# Altium schematic sheet Sch_Z35.SchDoc: Z35
size D; Author: Mohammadreza Zourmand; CompanyName: Daya; DrawnBy: Mohammadreza Zourmand; Engineer: Mohammadreza Zourmand; SheetNumber: 1; SheetTotal: 3; ProjectName: Birds Training
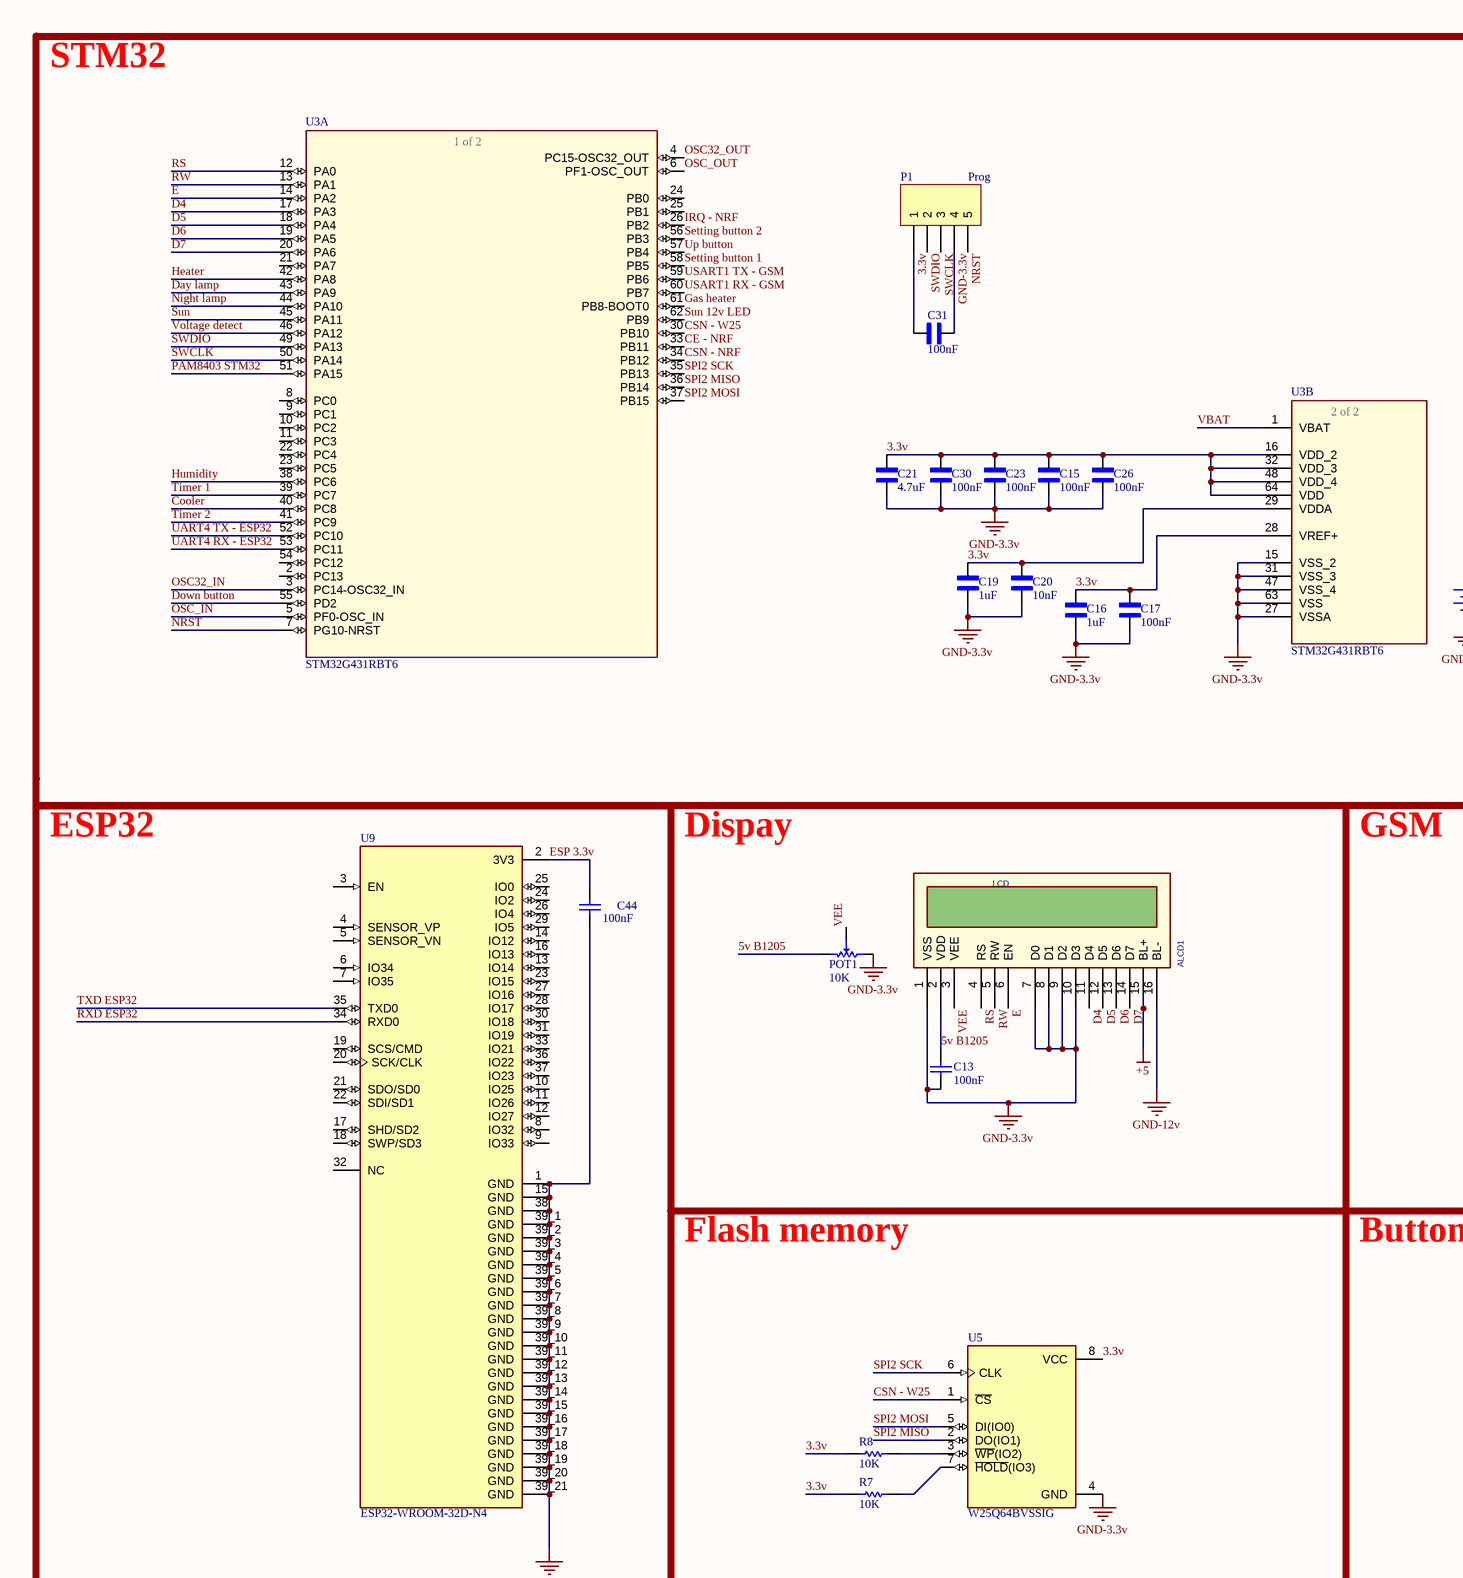
[diagram p0: Sch_Z35.SchDoc, top left]
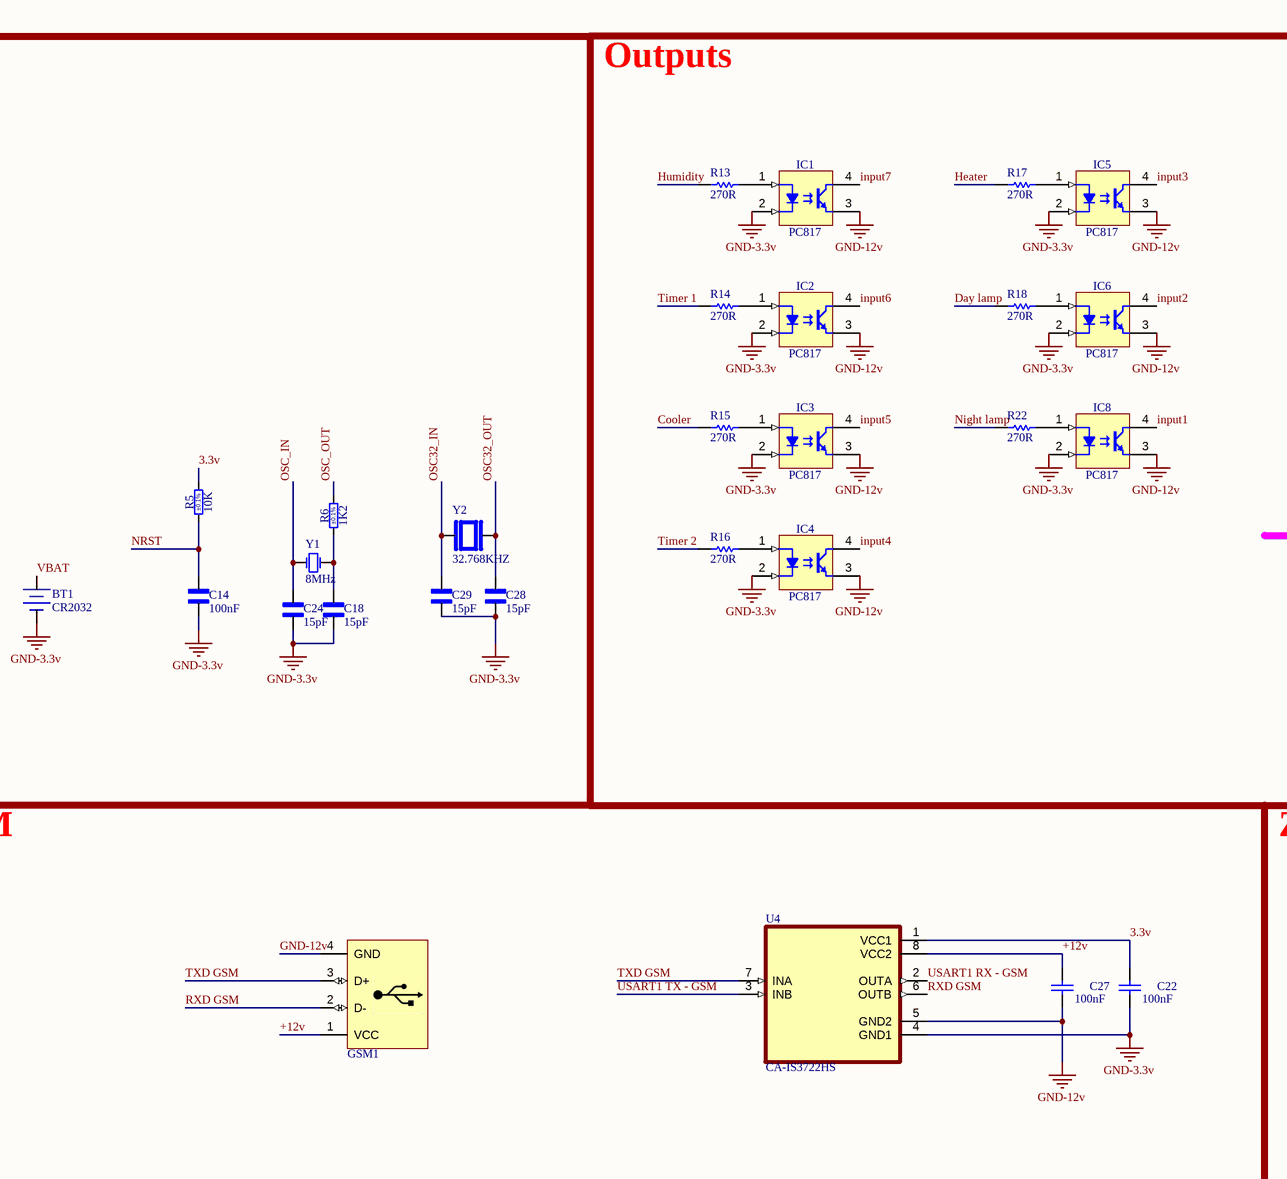
[diagram p1: Sch_Z35.SchDoc, top middle]
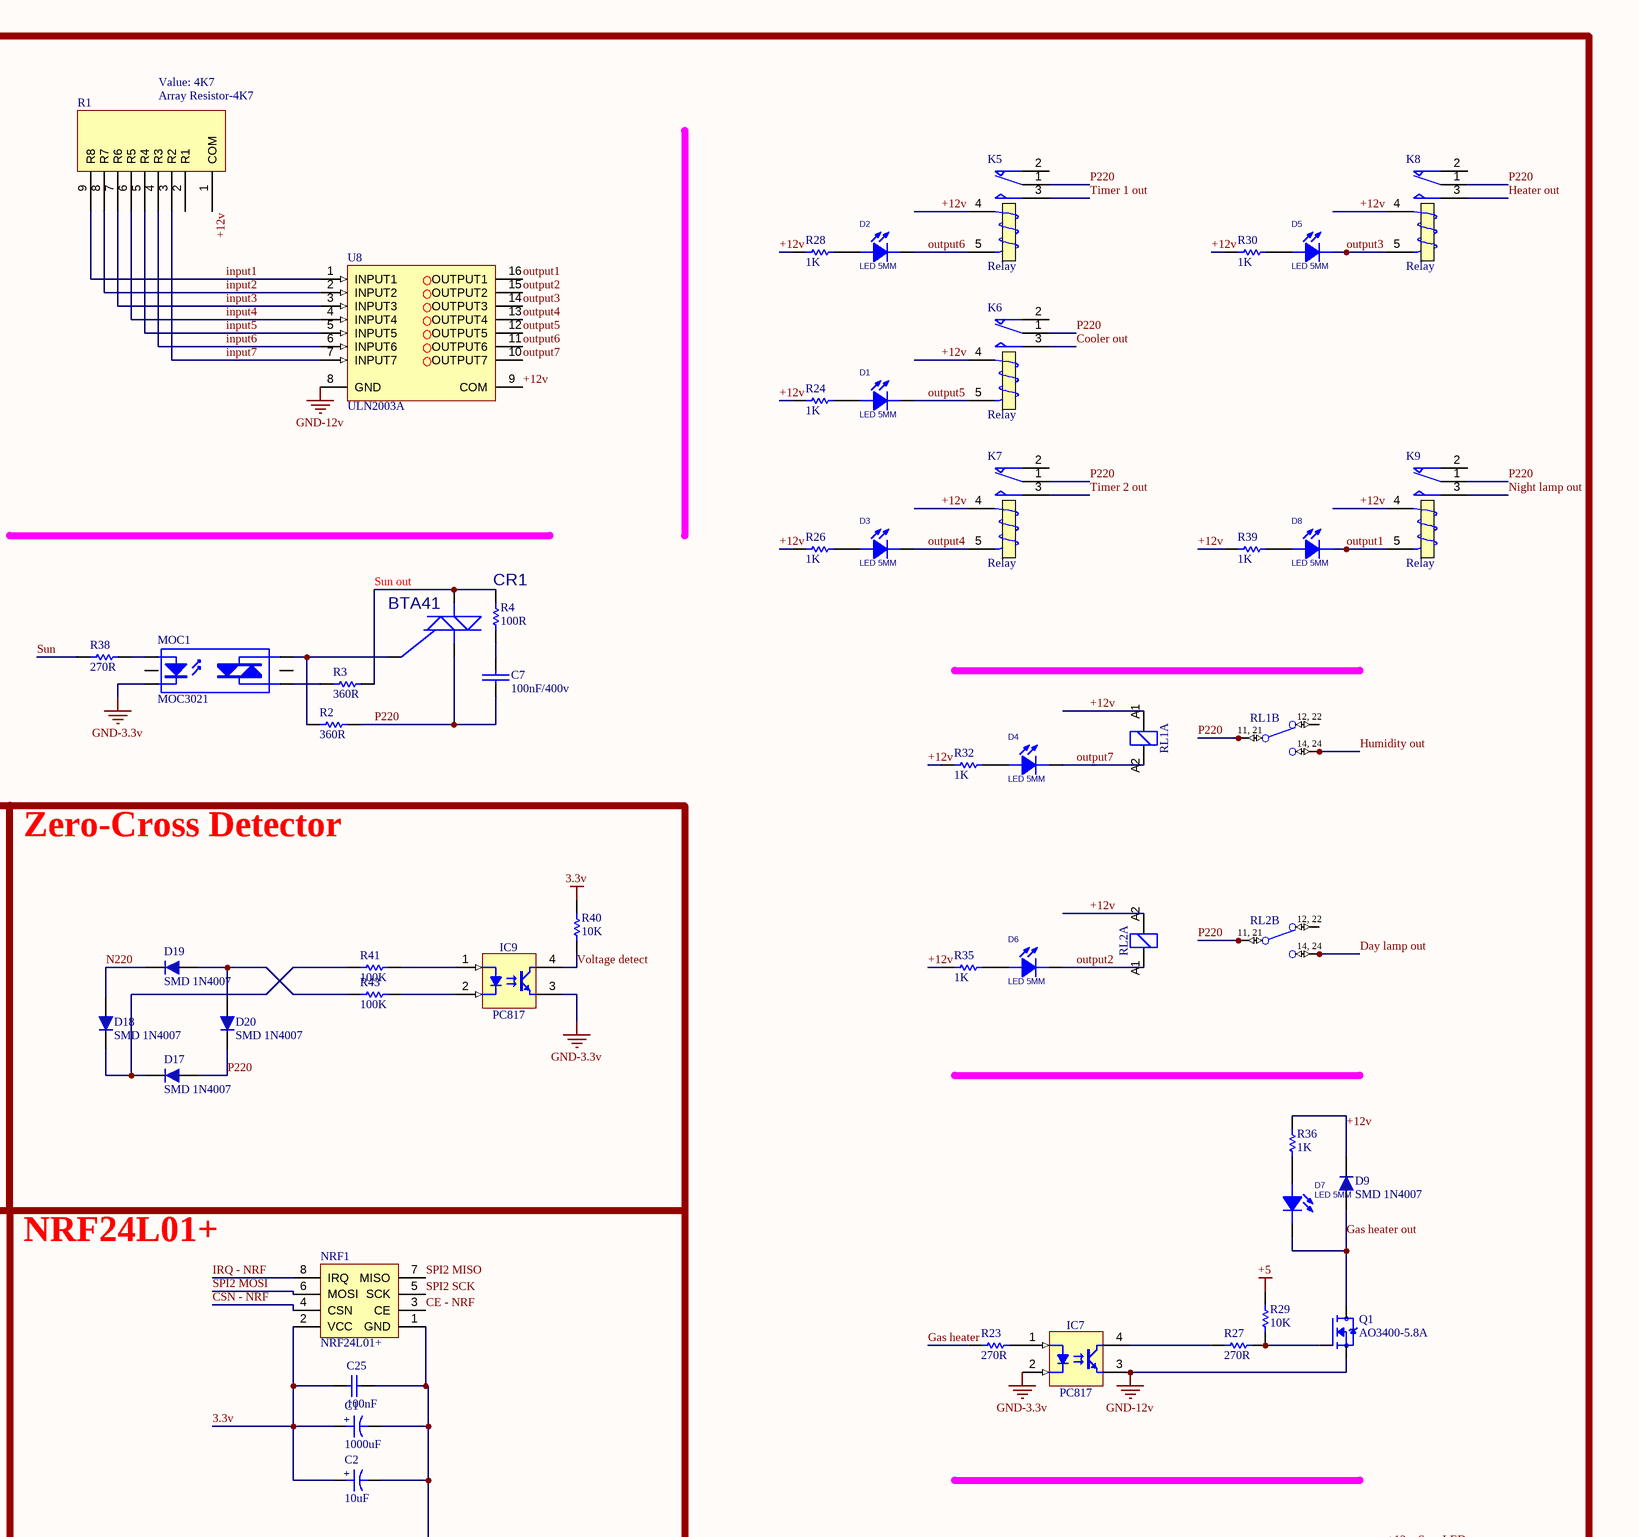
[diagram p2: Sch_Z35.SchDoc, top right]
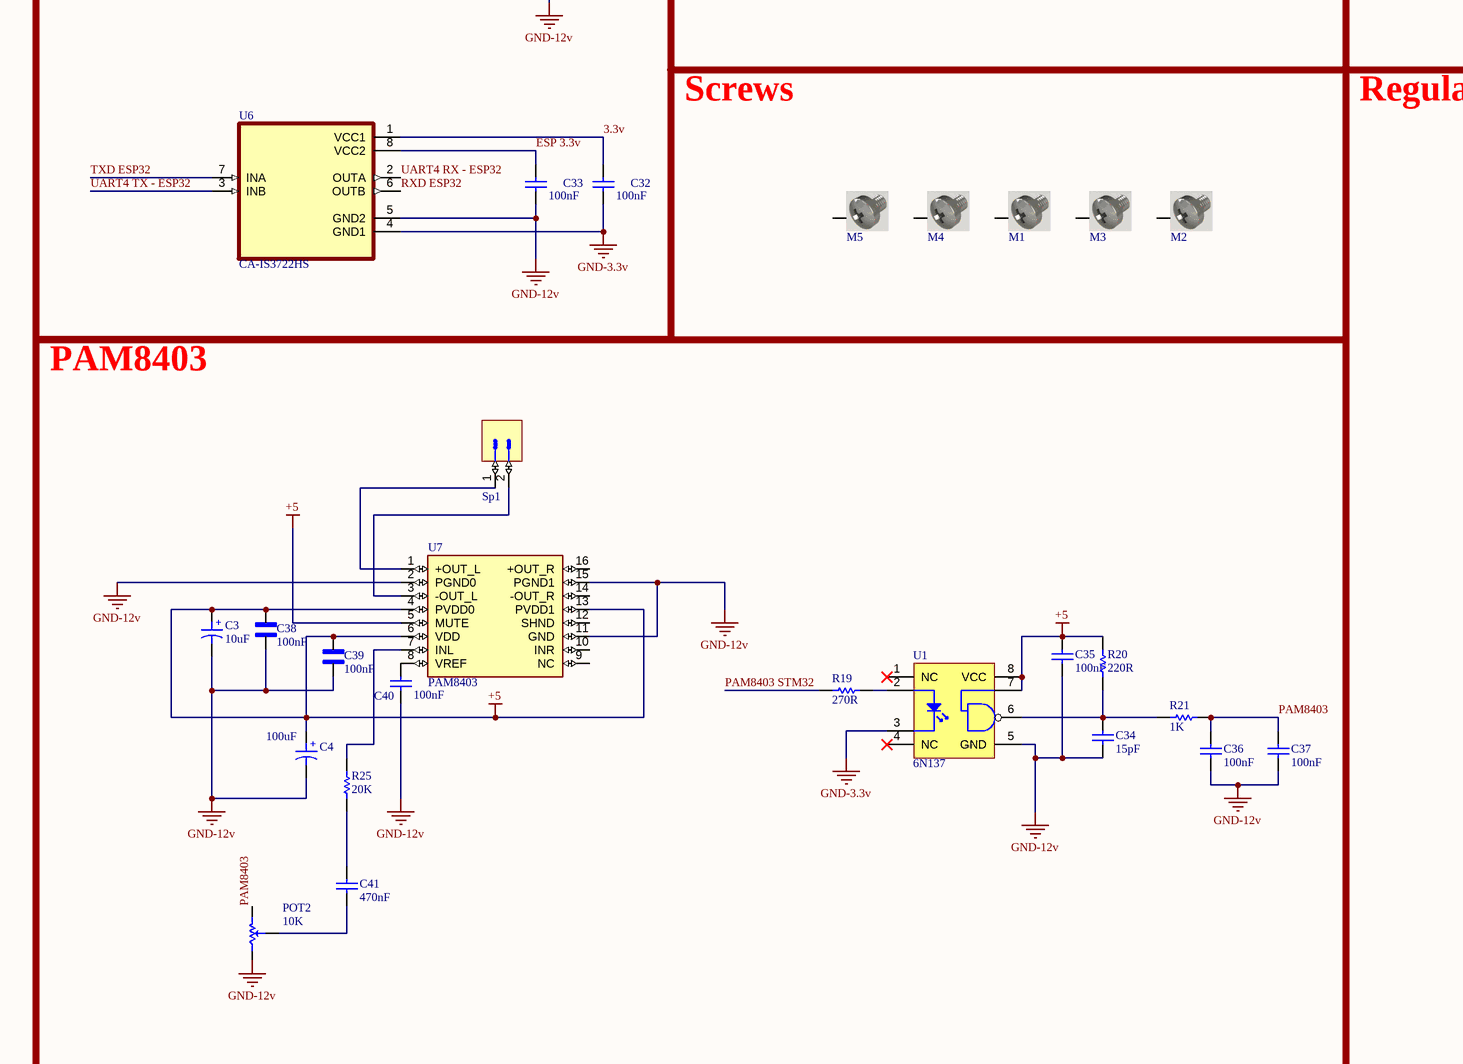
[diagram p3: Sch_Z35.SchDoc, bottom left]
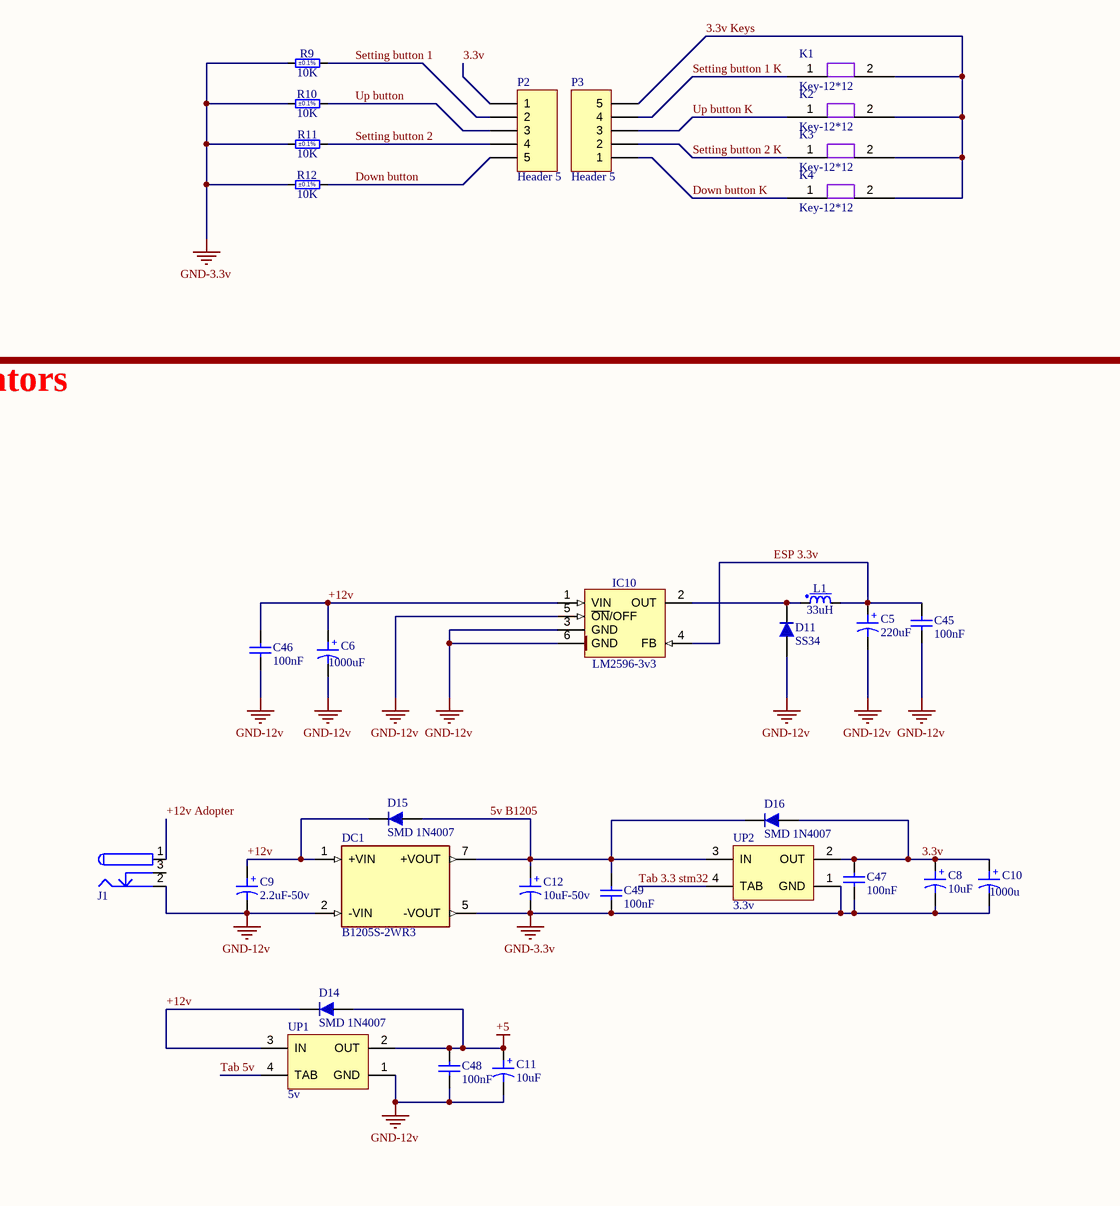
[diagram p4: Sch_Z35.SchDoc, bottom middle]
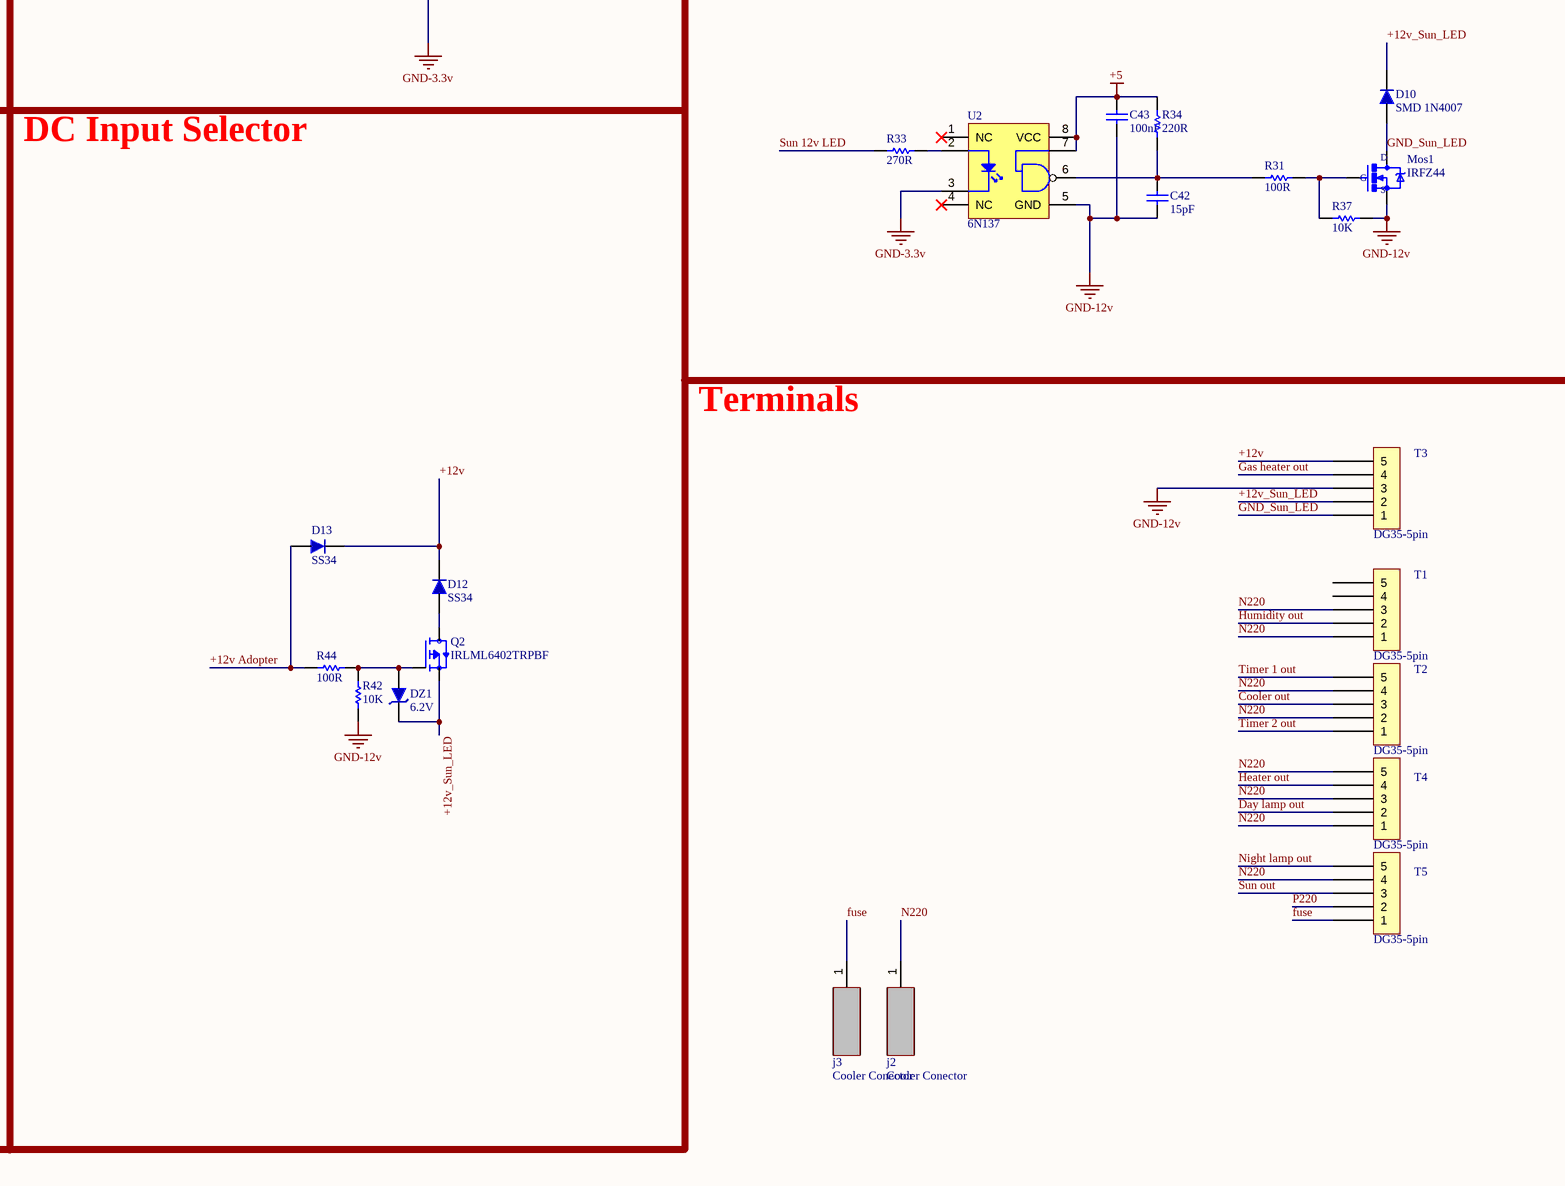
[diagram p5: Sch_Z35.SchDoc, bottom right]

## Parts
ALCD1  LCD  [LCD 16x2]
BT1  CR2032  [BAT BACKUP]
C1  1000uF  [Cap electrolitic radial 8x14-3.5]
C2  10uF  [Cap electrolitic radial 6.3x12-2.5]
C3  10uF  [Cap electrolitic radial 4x7-1.5]
C4  100uF  [Cap electrolitic radial 4x7-1.5]
C5  220uF  [Cap electrolitic radial 6.3x12-2.5]
C6  1000uF  [Cap electrolitic radial 8x14-3.5]
C7  100nF/400v  [Cap - 100nF - 400V]
C8  10uF  [Cap electrolitic radial 6.3x12-2.5]
C9  2.2uF-50v  [Cap electrolitic radial 4x7-1.5]
C10  1000u  [Cap electrolitic radial 8x14-3.5]
C11  10uF  [Cap electrolitic radial 6.3x12-2.5]
C12  10uF-50v  [Cap electrolitic radial 4x7-1.5]
C13  100nF  [CAPC3413X12N]
C14  100nF  [CAPC1608X90]
C15  100nF  [CAPC1608X90]
C16  1uF  [CAPC1608X90]
C17  100nF  [CAPC1608X90]
C18  15pF  [CAPC1608X90]
C19  1uF  [CAPC1608X90]
C20  10nF  [CAPC1608X90]
C21  4.7uF  [CAPC1608X90]
C22  100nF  [CAPC3413X12N]
C23  100nF  [CAPC1608X90]
C24  15pF  [CAPC1608X90]
C25  100nF  [CAPC3413X12N]
C26  100nF  [CAPC1608X90]
C27  100nF  [CAPC3413X12N]
C28  15pF  [CAPC1608X90]
C29  15pF  [CAPC1608X90]
C30  100nF  [CAPC1608X90]
C31  100nF  [CAPC1608X90]
C32  100nF  [CAPC3413X12N]
C33  100nF  [CAPC3413X12N]
C34  15pF  [CAPC3413X12N]
C35  100nF  [CAPC3413X12N]
C36  100nF  [CAPC3413X12N]
C37  100nF  [CAPC3413X12N]
C38  100nF  [CAPC1608X90]
C39  100nF  [CAPC1608X90]
C40  100nF  [CAPC3413X12N]
C41  470nF  [CAPC3413X12N]
C42  15pF  [CAPC3413X12N]
C43  100nF  [CAPC3413X12N]
C44  100nF  [CAPC3413X12N]
C45  100nF  [CAPC3413X12N]
C46  100nF  [CAPC3413X12N]
C47  100nF  [CAPC3413X12N]
C48  100nF  [CAPC3413X12N]
C49  100nF  [CAPC3413X12N]
CR1  BTA41  [BTA41]
D1  LED 5MM  [LED5MM_YELLOW]
D2  LED 5MM  [LED5MM_YELLOW]
D3  LED 5MM  [LED5MM_YELLOW]
D4  LED 5MM  [LED5MM_YELLOW]
D5  LED 5MM  [LED5MM_YELLOW]
D6  LED 5MM  [LED5MM_YELLOW]
D7  LED 5MM  [LED5MM_YELLOW]
D8  LED 5MM  [LED5MM_YELLOW]
D9  SMD 1N4007  [DIODE SMD]
D10  SMD 1N4007  [DIODE SMD]
D11  SS34  [DIODE SMD]
D12  SS34  [DIODE SMD]
D13  SS34  [DIODE SMD]
D14  SMD 1N4007  [DIODE SMD]
D15  SMD 1N4007  [DIODE SMD]
D16  SMD 1N4007  [DIODE SMD]
D17  SMD 1N4007  [DIODE SMD]
D18  SMD 1N4007  [DIODE SMD]
D19  SMD 1N4007  [DIODE SMD]
D20  SMD 1N4007  [DIODE SMD]
DC1  B1205S-2WR3  [CONV_RKZE-1205S/HP]
DZ1  6.2V  [SOD80, LL-34]
GSM1  USB Connector  [USB2.5-2H4C]  (value not drawn)
IC1  PC817  [WURTH_140817143400]
IC2  PC817  [WURTH_140817143400]
IC3  PC817  [WURTH_140817143400]
IC4  PC817  [WURTH_140817143400]
IC5  PC817  [WURTH_140817143400]
IC6  PC817  [WURTH_140817143400]
IC7  PC817  [WURTH_140817143400]
IC8  PC817  [WURTH_140817143400]
IC9  PC817  [WURTH_140817143400]
IC10  LM2596-3v3  [TO170P1435X465-6N-R1041X635]
J1  DC Power Jack  [DC Power Jack 1]  (value not drawn)
j2  Cooler Conector  [Cooler Conector]
j3  Cooler Conector  [Cooler Conector]
K1  Key-12*12  [Switch_11_11]
K2  Key-12*12  [Switch_11_11]
K3  Key-12*12  [Switch_11_11]
K4  Key-12*12  [Switch_11_11]
K5  Relay  [Relay 18.85x15.35x15.70]
K6  Relay  [Relay 18.85x15.35x15.70]
K7  Relay  [Relay 18.85x15.35x15.70]
K8  Relay  [Relay 18.85x15.35x15.70]
K9  Relay  [Relay 18.85x15.35x15.70]
L1  33uH  [IND_PANASONIC_ELL6RH]
M1  Screw3mm  [Board Screw 3mm]  (value not drawn)
M2  Screw3mm  [Board Screw 3mm]  (value not drawn)
M3  Screw3mm  [Board Screw 3mm]  (value not drawn)
M4  Screw3mm  [Board Screw 3mm]  (value not drawn)
M5  Screw3mm  [Board Screw 3mm]  (value not drawn)
MOC1  MOC3021  [DIP-6]
Mos1  IRFZ44  [TO-220]
NRF1  NRF24L01+  [NRF24L01P]
P1  Prog  [HDR1X5]
P2  Header 5  [HDR1X5]
P3  Header 5  [HDR1X5]
POT1  10K  [POT 4]
POT2  10K  [POT 4]
Q1  AO3400-5.8A  [SOT95P260X140-3N]
Q2  IRLML6402TRPBF  [SOT95P237X112-3N]
R1  Array Resistor-4K7  value 4K7  [Res Array]
R2  360R  [Axial 0_25 W, 0_4 IN LEAD PITCH]
R3  360R  [Axial 0_25 W, 0_4 IN LEAD PITCH]
R4  100R  [Axial 0_25 W, 0_4 IN LEAD PITCH]
R5  10K  Tolerance: ±0.1%  [RESC1608X55N]
R6  1K2  Tolerance: ±0.1%  [RESC1608X55N]
R7  10K  [RESC3413X04N]
R8  10K  [RESC3413X04N]
R9  10K  Tolerance: ±0.1%  [RESC1608X55N]
R10  10K  Tolerance: ±0.1%  [RESC1608X55N]
R11  10K  Tolerance: ±0.1%  [RESC1608X55N]
R12  10K  Tolerance: ±0.1%  [RESC1608X55N]
R13  270R  [RESC3413X04N]
R14  270R  [RESC3413X04N]
R15  270R  [RESC3413X04N]
R16  270R  [RESC3413X04N]
R17  270R  [RESC3413X04N]
R18  270R  [RESC3413X04N]
R19  270R  [RESC3413X04N]
R20  220R  [RESC3413X04N]
R21  1K  [RESC3413X04N]
R22  270R  [RESC3413X04N]
R23  270R  [RESC3413X04N]
R24  1K  [RESC4817X04N]
R25  20K  [RESC3413X04N]
R26  1K  [RESC4817X04N]
R27  270R  [RESC3413X04N]
R28  1K  [RESC4817X04N]
R29  10K  [RESC3413X04N]
R30  1K  [RESC4817X04N]
R31  100R  [RESC3413X04N]
R32  1K  [RESC4817X04N]
R33  270R  [RESC3413X04N]
R34  220R  [RESC3413X04N]
R35  1K  [RESC4817X04N]
R36  1K  [RESC4817X04N]
R37  10K  [RESC3413X04N]
R38  270R  [RESC3413X04N]
R39  1K  [RESC4817X04N]
R40  10K  [RESC3413X04N]
R41  100K  [RESC4817X04N]
R42  10K  [RESC3413X04N]
R43  100K  [RESC4817X04N]
R44  100R  [RESC3413X04N]
RL1  REL_FINDER_40.61  [REL_FINDER_40.61]  (value not drawn)  (parts A,B of 2)
RL2  REL_FINDER_40.61  [REL_FINDER_40.61]  (value not drawn)  (parts A,B of 2)
Sp1  KK®  [MOLEX_22-04-1021]  (value not drawn)
T1  DG35-5pin  [DG35-5pin]
T2  DG35-5pin  [DG35-5pin]
T3  DG35-5pin  [DG35-5pin]
T4  DG35-5pin  [DG35-5pin]
T5  DG35-5pin  [DG35-5pin]
U1  6N137  [DIP8]
U2  6N137  [DIP8]
U3  STM32G431RBT6  [LQFP64-10X10MM]  (parts A,B of 2)
U4  CA-IS3722HS  [SOIC127P599X175-8N]
U5  W25Q64BVSSIG  [SOIC127P790X216-8N]
U6  CA-IS3722HS  [SOIC127P599X175-8N]
U7  PAM8403  [SOP-16]
U8  ULN2003A  [SO16_M]
U9  ESP32-WROOM-32D-N4  [MODULE_ESP32-WROOM-32D-N4]
UP1  5v  [SOT223]
UP2  3.3v  [SOT223]
Y1  8MHz  [Crystal SMD]
Y2  32.768KHZ  [XTAL_ABS09-32.768KHZ-T]

## Blocks framed on the sheet
ESP32: C32 C33 C44 U6 U9

## Nets
3.3v: C1.1 C2.1 C8.1 C10.1 C15.1 C16.1 C17.1 C19.1 C20.1 C21.1 C22.1 C23.1 C25.2 C26.1 C30.1 C31.1 C32.1 C47.1 D16.1 NRF1.2(VCC) P1.1 P2.1 R5.2 R7.2 R8.2 R40.1 U3.16(VDD_2) U3.28(VREF+) U3.29(VDDA) U3.32(VDD_3) U3.48(VDD_4) U3.64(VDD) U4.1(VCC1) U5.8(VCC) U6.1(VCC1) UP2.2(OUT)
+5: ALCD1.15(BL+) C3.1 C4.1 C11.1 C35.1 C38.1 C39.1 C43.1 C48.1 D14.1 R20.2 R29.2 R34.2 U1.7(Ve) U1.8(VCC) U2.7(Ve) U2.8(VCC) U7.4(PVDD0) U7.5(MUTE) U7.6(VDD) U7.13(PVDD1) UP1.2(OUT)
GND-3.3v: ALCD1.1(VSS) ALCD1.7(D0) ALCD1.8(D1) ALCD1.9(D2) ALCD1.10(D3) BT1.2(-) C1.2 C2.2 C8.2 C10.2 C12.2 C13.2 C14.2 C15.2 C16.2 C17.2 C18.2 C19.2 C20.2 C21.2 C22.2 C23.2 C24.2 C25.1 C26.2 C28.2 C29.2 C30.2 C31.2 C32.2 C47.2 C49.2 DC1.5(-VOUT) IC1.2(C) IC2.2(C) IC3.2(C) IC4.2(C) IC5.2(C) IC6.2(C) IC7.2(C) IC8.2(C) IC9.3(E) MOC1.2(K) NRF1.1(GND) P1.4 POT1.1(CCW) R9.1 R10.1 R11.1 R12.1 U1.3(K) U2.3(K) U3.15(VSS_2) U3.27(VSSA) U3.31(VSS_3) U3.47(VSS_4) U3.63(VSS) U4.4(GND1) U5.4(GND) U6.4(GND1) UP2.1(GND)
GND-12v: ALCD1.16(BL-) C3.2 C4.2 C5.2 C6.2 C9.2 C11.2 C27.2 C33.2 C34.2 C35.2 C36.2 C37.2 C38.2 C39.2 C40.2 C42.2 C43.2 C44.2 C45.2 C46.2 C48.2 D11.1 DC1.2(-VIN) GSM1.4(GND) IC1.3(E) IC2.3(E) IC3.3(E) IC4.3(E) IC5.3(E) IC6.3(E) IC7.3(E) IC8.3(E) IC10.3(GND) IC10.5(~{ON}/OFF) IC10.6(GND) J1.2 Mos1.3(S) POT2.1(CCW) Q1.2(S) R37.1 R42.2 T3.3 U1.5(GND) U2.5(GND) U4.5(GND2) U6.5(GND2) U7.2(PGND0) U7.11(GND) U7.15(PGND1) U8.8(GND) U9.1(GND) U9.15(GND) U9.38(GND) U9.39_1(GND) U9.39_2(GND) U9.39_3(GND) U9.39_4(GND) U9.39_5(GND) U9.39_6(GND) U9.39_7(GND) U9.39_8(GND) U9.39_9(GND) U9.39_10(GND) U9.39_11(GND) U9.39_12(GND) U9.39_13(GND) U9.39_14(GND) U9.39_15(GND) U9.39_16(GND) U9.39_17(GND) U9.39_18(GND) U9.39_19(GND) U9.39_20(GND) U9.39_21(GND) UP1.1(GND)
3.3v Keys: K1.2 K2.2 K3.2 K4.2 P3.5
5v B1205: ALCD1.2(VDD) C12.1 C13.1 C49.1 D15.1 D16.2 DC1.7(+VOUT) POT1.2(CW) UP2.3(IN)
+12v: C6.1 C9.1 C27.1 C46.1 D9.2 D12.2 D13.2 D14.2 D15.2 DC1.1(+VIN) GSM1.1(VCC) IC10.1(VIN) K5.4(T1) K6.4(T1) K7.4(T1) K8.4(T1) K9.4(T1) R1.1(COM) R24.1 R26.1 R28.1 R30.1 R32.1 R35.1 R36.2 R39.1 RL1.A1(COIL) RL2.A2(COIL) T3.5 U4.8(VCC2) U8.9(COM) UP1.3(IN)
+12v Adopter: D13.1 J1.1 R44.2
+12v_Sun_LED: D10.2 DZ1.2 Q2.2(S) T3.2
CE - NRF: NRF1.3(CE) U3.33(PB11)
Cooler: R15.2 U3.40(PC8)
Cooler out: K6.3(NO) T2.3
CSN - NRF: NRF1.4(CSN) U3.34(PB12)
CSN - W25: U3.30(PB10) U5.1(~{CS})
D4: ALCD1.11(D4) U3.17(PA3)
D5: ALCD1.12(D5) U3.18(PA4)
D6: ALCD1.13(D6) U3.19(PA5)
D7: ALCD1.14(D7) U3.20(PA6)
Day lamp: R18.2 U3.43(PA9)
Day lamp out: RL2.14(NO) RL2.24(NO) T4.2
Down button: P2.5 R12.2 U3.55(PD2)
Down button K: K4.1 P3.1
E: ALCD1.6(EN) U3.14(PA2)
ESP 3.3v: C5.1 C33.1 C44.1 C45.1 IC10.4(FB) L1.2 U6.8(VCC2) U9.2(3V3)
fuse: j3.1 T5.1
Gas heater: R23.2 U3.61(PB8-BOOT0)
Gas heater out: D7.2(CATHODE) D9.1 Q1.3(D) T3.4
GND_Sun_LED: D10.1 Mos1.2(D) T3.1
Heater: R17.2 U3.42(PA8)
Heater out: K8.3(NO) T4.4
Humidity: R13.2 U3.38(PC6)
Humidity out: RL1.14(NO) RL1.24(NO) T1.2
input1: IC8.4(C) R1.9(R8) U8.1(INPUT1)
input2: IC6.4(C) R1.8(R7) U8.2(INPUT2)
input3: IC5.4(C) R1.7(R6) U8.3(INPUT3)
input4: IC4.4(C) R1.6(R5) U8.4(INPUT4)
input5: IC3.4(C) R1.5(R4) U8.5(INPUT5)
input6: IC2.4(C) R1.4(R3) U8.6(INPUT6)
input7: IC1.4(C) R1.3(R2) U8.7(INPUT7)
IRQ - NRF: NRF1.8(IRQ) U3.26(PB2)
N220: D18.1 D19.2 j2.1 T1.1 T1.3 T2.2 T2.4 T4.1 T4.3 T4.5 T5.4
Night lamp: R22.2 U3.44(PA10)
Night lamp out: K9.3(NO) T5.5
NRST: C14.1 P1.5 R5.1 U3.7(PG10-NRST)
OSC32_IN: C29.1 U3.3(PC14-OSC32_IN) Y2.2
OSC32_OUT: C28.1 U3.4(PC15-OSC32_OUT) Y2.1
OSC_IN: C24.1 U3.5(PF0-OSC_IN) Y1.1(OSC1)
OSC_OUT: R6.2 U3.6(PF1-OSC_OUT)
output1: D8.2(CATHODE) K9.5(T2) U8.16(OUTPUT1)
output2: D6.2(CATHODE) RL2.A1(COIL) U8.15(OUTPUT2)
output3: D5.2(CATHODE) K8.5(T2) U8.14(OUTPUT3)
output4: D3.2(CATHODE) K7.5(T2) U8.13(OUTPUT4)
output5: D1.2(CATHODE) K6.5(T2) U8.12(OUTPUT5)
output6: D2.2(CATHODE) K5.5(T2) U8.11(OUTPUT6)
output7: D4.2(CATHODE) RL1.A2(COIL) U8.10(OUTPUT7)
P220: C7.2(-) CR1.1(A1) D17.1 D20.2 K5.1(COM) K6.1(COM) K7.1(COM) K8.1(COM) K9.1(COM) R2.2 RL1.11(C) RL1.21(C) RL2.11(C) RL2.21(C) T5.2
PAM8403: C36.1 C37.1 POT2.2(CW) R21.1
PAM8403 STM32: R19.2 U3.51(PA15)
RS: ALCD1.4(RS) U3.12(PA0)
RW: ALCD1.5(RW) U3.13(PA1)
RXD ESP32: U6.6(OUTB) U9.34(RXD0)
RXD GSM: GSM1.2(D-) U4.6(OUTB)
Setting button 1: P2.2 R9.2 U3.58(PB5)
Setting button 1 K: K1.1 P3.4
Setting button 2: P2.4 R11.2 U3.56(PB3)
Setting button 2 K: K3.1 P3.2
SPI2 MISO: NRF1.7(MISO) U3.36(PB14) U5.2(DO(IO1))
SPI2 MOSI: NRF1.6(MOSI) U3.37(PB15) U5.5(DI(IO0))
SPI2 SCK: NRF1.5(SCK) U3.35(PB13) U5.6(CLK)
Sun: R38.2 U3.45(PA11)
Sun 12v LED: R33.2 U3.62(PB9)
Sun out: CR1.2(A2) R3.2 R4.2 T5.3
SWCLK: P1.3 U3.50(PA14)
SWDIO: P1.2 U3.49(PA13)
Tab 3.3 stm32: UP2.4(TAB)
Tab 5v: UP1.4(TAB)
Timer 1: R14.2 U3.39(PC7)
Timer 1 out: K5.3(NO) T2.5
Timer 2: R16.2 U3.41(PC9)
Timer 2 out: K7.3(NO) T2.1
TXD ESP32: U6.7(INA) U9.35(TXD0)
TXD GSM: GSM1.3(D+) U4.7(INA)
UART4 RX - ESP32: U3.53(PC11) U6.2(OUTA)
UART4 TX - ESP32: U3.52(PC10) U6.3(INB)
Up button: P2.3 R10.2 U3.57(PB4)
Up button K: K2.1 P3.3
USART1 RX - GSM: U3.60(PB7) U4.2(OUTA)
USART1 TX - GSM: U3.59(PB6) U4.3(INB)
VBAT: BT1.1(+) U3.1(VBAT)
VEE: ALCD1.3(VEE) POT1.3(SetPoint)
Voltage detect: IC9.4(C) R40.2 U3.46(PA12)
NetC7_1: C7.1(+) R4.1
NetC18_1: C18.1 R6.1 Y1.2(OSC2)
NetC34_1: C34.1 R20.1 R21.2 U1.6(Vo)
NetC40_1: C40.1 U7.8(VREF)
NetC41_1: C41.1 R25.1
NetC41_2: C41.2 POT2.3(SetPoint)
NetC42_1: C42.1 R31.2 R34.1 U2.6(Vo)
NetCR1_3: CR1.3(G) MOC1.4(A/K) R2.1
NetD1_1: D1.1(ANODE) R24.2
NetD2_1: D2.1(ANODE) R28.2
NetD3_1: D3.1(ANODE) R26.2
NetD4_1: D4.1(ANODE) R32.2
NetD5_1: D5.1(ANODE) R30.2
NetD6_1: D6.1(ANODE) R35.2
NetD7_1: D7.1(ANODE) R36.1
NetD8_1: D8.1(ANODE) R39.2
NetD11_2: D11.2 IC10.2(OUT) L1.1
NetD12_1: D12.1 Q2.3(D)
NetD17_2: D17.2 D18.2 R41.1
NetD19_1: D19.1 D20.1 R43.1
NetDZ1_1: DZ1.1 Q2.1(G) R42.1 R44.1
NetIC1_1: IC1.1(A) R13.1
NetIC2_1: IC2.1(A) R14.1
NetIC3_1: IC3.1(A) R15.1
NetIC4_1: IC4.1(A) R16.1
NetIC5_1: IC5.1(A) R17.1
NetIC6_1: IC6.1(A) R18.1
NetIC7_1: IC7.1(A) R23.1
NetIC7_4: IC7.4(C) R27.1
NetIC8_1: IC8.1(A) R22.1
NetIC9_1: IC9.1(A) R41.2
NetIC9_2: IC9.2(C) R43.2
NetMOC1_1: MOC1.1(A) R38.1
NetMOC1_6: MOC1.6(A/K) R3.1
NetMos1_1: Mos1.1(G) R31.1 R37.2
NetQ1_1: Q1.1(G) R27.2 R29.1
NetR7_1: R7.1 U5.7(~{HOLD}(IO3))
NetR8_1: R8.1 U5.3(~{WP}(IO2))
NetR19_1: R19.1 U1.2(A)
NetR25_2: R25.2 U7.7(INL)
NetR33_1: R33.1 U2.2(A)
NetRL1_12: RL1.12(NC) RL1.22(NC)
NetRL2_12: RL2.12(NC) RL2.22(NC)
NetSp1_1: Sp1.1 U7.1(+OUT_L)
NetSp1_2: Sp1.2 U7.3(-OUT_L)

Not connected (* = marked no-connect by the designer): J1 3; K5 2(NC); K6 2(NC); K7 2(NC); K8 2(NC); K9 2(NC); M1 S; M2 S; M3 S; M4 S; M5 S; MOC1 3(NC) 5(NC); R1 2(R1); T1 4 5; U1 1(NC)* 4(NC)*; U2 1(NC)* 4(NC)*; U3 2(PC13) 8(PC0) 9(PC1) 10(PC2) 11(PC3) 21(PA7) 22(PC4) 23(PC5) 24(PB0) 25(PB1) 54(PC12); U7 9(NC) 10(INR) 12(SHND) 14(-OUT_R) 16(+OUT_R); U9 3(EN) 4(SENSOR_VP) 5(SENSOR_VN) 6(IO34) 7(IO35) 8(IO32) 9(IO33) 10(IO25) 11(IO26) 12(IO27) 13(IO14) 14(IO12) 16(IO13) 17(SHD/SD2) 18(SWP/SD3) 19(SCS/CMD) 20(SCK/CLK) 21(SDO/SD0) 22(SDI/SD1) 23(IO15) 24(IO2) 25(IO0) 26(IO4) 27(IO16) 28(IO17) 29(IO5) 30(IO18) 31(IO19) 32(NC) 33(IO21) 36(IO22) 37(IO23)

## Notes on the sheet
- STM32
- Outputs
- Dispay
- GSM
- Zero-Cross Detector
- Flash memory
- Buttons
- NRF24L01+
- Screws
- Regulators
- DC Input Selector
- PAM8403
- Terminals
- DWG. NO.
- REV.
- SHT.
- REVISION
- DESCRIPTION
- DATE
- APPROVED
- THIS DOCUMENT AND THE DATA DISCLOSED HEREIN OR HEREWITH IS THE PROPERTY OF ALTIUM LIMITED AND MAY BE FREELY DISTRIBUTED IN WHOLE. NO RIGHTS ARE RESERVED OR EXPRESS OR IMPLIED WARANTEE GIVEN.
- ENG:
- DSN:
- APPROVALS
- PROJECT
- DOCUMENT REVISION:
- DESIGN ITEM:
- CHK:
- BOM:
- REFERENCE DOCUMENTS
- PROJECT REVISION:
- TITLE
- FAB DWG:
- PCB DWG:
- ASSY DWG:
- SCALE:
- SIZE
- D
- CAGE CODE
- FILE NAME
- DWG NO.
- SHEET
- OF
- REV
- (in symbol Cap ELECTROLITIC TOTAL SIZE) +
- (in symbol REL_FINDER_40.61.9.009.0000, part B) 12, 22; 11, 21; 14, 24
- (in symbol STM32G431RBT6, part A) 1 of 2
- (in symbol STM32G431RBT6, part B) 2 of 2

## Library data of the parts
ALCD1 = LCD: Alphanumic LCD; Designer: Abbas Basereh; Data: 16-12-2016
BT1 = Battry Backup: Designer: Abbas Basereh; Data: 16-12-2016; Link: *; Part. No: *
C1-C6 C8-C12 = Cap ELECTROLITIC TOTAL SIZE: Cap electrolitic radial; Designer: Abbas Basereh; VALUE: 1uF; Data: 16-12-2016; Part. No: *
C7 = Cap-Bipolar: Bipolar Capacitor; Voltage: 100V; Designer: Saeid Jorablo; Organazation: ControTec; Adding Date: 1387/12/20; Value: 100nF/400v
C13 C22 C25 C27 C32-C37 C40-C49 = CAP SMD 0805: CAP 0805; Designer: Abbas Basereh; Desc.: CAP SMD 0805; Data: 16-12-2016
C14-C21 C23 C24 C26 C28-C31 C38 C39 = Cap 0603: 0603 C 100nF Ceramic Multilayer Capacitor, 25 V, +125degC, X7R Dielectric, +/-5% | KEMET C0603C104J3RACTU; SnapEDA_Link: https://www.snapeda.com/parts/C0603C104J3RACTU/KEMET/view-part/?ref=snap; Package: 603-2 KEMET; Value: *; MF: KEMET; MP: C0603C104J3RACTU; Check_prices: https://www.snapeda.com/parts/C0603C104J3RACTU/KEMET/view-part/?ref=eda
CR1 = BTA41: Manufacturer_Part_Number: BTA41-600BRG; C: Copyright (C) 2015 Accelerated Designs. All rights reserved; Vendor: STMicroelectronics; Built_By: EMA_UL_Team; SourceLibrary: StMicro_2011-06-07
D1-D8 = LED 5MM: Light Emitting Diode; Designer: Abbas Basereh; Data: 16-12-2016; Link: *; Part.No: *
D9-D20 = Diode SMD Package: Diode SMD Pakage
DC1 = B1205S-2WR3: 2W, constant voltage input, isolated ,unregulated single output, DC DC power module; MP: RKZE-1205S/HP; Package: None; Price: None; Value: *; Availability: Unavailable
DZ1 = ZENER GENERAL DIODE: DIODE ZENER GENERAL; VALUE: 12V; Published: 2017-1-12; PackageVersion: 2017-1-12; PackageReference: DO 35; Publisher: Abbas Basereh; PackageDescription: DIODE GEN ZENER; ComponentLink1Description: Manufacturer Link; ComponentLink2Description: Datasheet
GSM1 = USB A-Type: USB Connector-A Type
IC1-IC9 = 140817143400: Single Optocoupler-PC817; Part Description: WL-OCPT Optocoupler Phototransistor; Manufacturer: WURTH; PressFit: No; Bonding: No; Part Number: 140817143400; Component Kind: Standard; Component Type: Standard; Device: 140817143400; PackageDescription: DIP Gull Wing Surface Mount, 2.54mm Pitch; 4 Pin, 6.5mm W X 4.58mm L X 3.9mm H body, WURTH; Manufacturer Part Number: 140817143400; Pin Count: 4; Case: DIP4 SMD; Mounted: Yes; Socket: No; SMD: Yes; Sense: No; ComponentHeight: 3.9mm; HelpURL: \\cern.ch\dfs\Applications\Altium\Datasheets\WURTH_140817143400.pdf; Author: CERN DEM HF; CreateDate: 4/5/2023; LatestRevisionDate: 4/5/2023
IC10 = LM2596S-5.0/NOPB: SIMPLE SWITCHER® Power Converter 150kHz, 3A Step-Down Voltage Regulator; Part Description: 4.5V to 40V Input to 5V Output, SIMPLE SWITCHER® Power Converter 150kHz, 3A Step-Down Voltage Regulator; Manufacturer: TEXAS INSTRUMENTS; PressFit: No; Bonding: No; Part Number: LM2596S-5.0/NOPB; Component Kind: Standard; Component Type: Standard; Device: LM2596S-5.0/NOPB; PackageDescription: D2PAK TO-263, TO, 1.70mm Pitch; 5 Pin, 14.35mm L X 8.64mm W X 4.65mm H body IPC Medium Density; Manufacturer Part Number: LM2596S-5.0; Pin Count: 6; Case: TO-263-5; Mounted: Yes; Socket: No; SMD: Yes; Sense: No; ComponentHeight: 4.65mm; HelpURL: \\cern.ch\dfs\Applications\Altium\Datasheets\LM2596S-5.0-NOPB.pdf; Author: CERN DEM JLC; CreateDate: 12/19/2018; LatestRevisionDate: 6/1/2022
J1 = DC Power Jack: DC Power Jack. Center Pin 2.5mm. Diameter: 5.7mm; Designer: Ali Hafizi; Company: Personal; Project Name: Laser; Adding Date: 10/21/2009
j2 j3 = Cooler Conector: 0.5mm pins
K1-K4 = Switch_11_11
K5-K9 = Relay: SPDT Relay; Designer: Eng. Saeid Jorablo; Company: E.P.I.L; Design_Date: 2011/10/31
L1 = IND_33UH_20%_PANASONIC_ELL6RH330M: Inductor With Magnetic core 1Dot; Part Description: SMD Choke Coil; Power: 600mA; Resistance: 0.38R; Tolerance: ±20%; Part Number: IND_33UH_20%_PANASONIC_ELL6RH330M; Component Kind: Standard; Component Type: Standard; Pin Count: 2; Value: 33uH; Manufacturer: PANASONIC; Manufacturer Part Number: ELL6RH330M; Mounted: Yes; Socket: No; SMD: Yes; Sense: No; ComponentHeight: 2.8mm; HelpURL: \\cern.ch\dfs\Applications\Altium\Datasheets\IND_PANASONIC_ELL6RH.pdf; Author: CERN DEM JMW; CreateDate: 1/9/2009; LatestRevisionDate: 1/9/2009
M1-M5 = Board Screw 3mm: Board Screw With Spacer 3mm; Designer: Abbas Basereh; Data: 16-12-2016; Link: *; Part. No: *
MOC1 = MOC3021-3: Opto-Triac; Designer: Seyed Mohsen Ghasemian; E-mail: picpars@gmail.com; Published: 17-11-2011; LatestRevisionDate: 17-11-2011; Publisher: www.picpars.com; WEB: www.picpars.com
Mos1 = IRFZ44: N-Channel 55V 51A _Tc_ 80W _Tc_ Through Hole TO-220AB; MF: Infineon Technologies; Value: *; Price: None; Package: TO-220 Infineon Technologies; SnapEDA_Link: https://www.snapeda.com/parts/IRFZ44/Infineon%20Technologies/view-part/568085/?ref=snap; Availability: Unavailable; MP: IRFZ44
NRF1 = NRF24L01P: RF Module; Ali Hafizi: Creature
P1-P3 = Header 5: Header, 5-Pin; LatestRevisionDate: 17-Jul-2002; LatestRevisionNote: Re-released for DXP Platform.; Publisher: Altium Limited
POT1 POT2 = POT: Variable Resistor; Value: 10K
Q1 = AO3400-5.8A: N-Channel 30 V 5.8A (Ta) 1.5W (Ta) Surface Mount SOT-23; MF: MDD; Check_prices: https://www.snapeda.com/parts/AO3400-5.8A/MDD/view-part/?ref=eda; Value: *; Availability: In Stock; MP: AO3400-5.8A; Price: None; Package: None; SnapEDA_Link: https://www.snapeda.com/parts/AO3400-5.8A/MDD/view-part/?ref=snap; Purchase-URL: https://pricing.snapeda.com/search/part/AO3400-5.8A/?ref=eda
Q2 = IRLML6402TRPBF: P-Channel 20 V 3.7A (Ta) 1.3W (Ta) Surface Mount Micro3Ã¢â€žÂ¢ /SOT-23; MF: Infineon; SnapEDA_Link: https://www.snapeda.com/parts/IRLML6402TRPBF/Infineon/view-part/?ref=snap; Package: SOT-23-3 ON Semiconductor; Value: *; MP: IRLML6402TRPBF; Check_prices: https://www.snapeda.com/parts/IRLML6402TRPBF/Infineon/view-part/?ref=eda
R1 = RES Array: Resistor Pack
R2-R4 = RES Axial 0.25W: Designer: Abbas Basereh; Desc.: RES Axial 0.25W; Data: 4-1-2017
R5 R6 R9-R12 = R0603_100K_0.1%_0.063W_10PPM: Resistor - 0.1%; Part Description: Thin Film Chip Resistor; Manufacturer: GENERIC; Manufacturer1 Part Number: RN73C1J100KBTDF; Value: 100k; Power: 0.063W; TC: ±10ppm; PressFit: No; Part Number: R0603_100K_0.1%_0.063W_10PPM; Component Kind: Standard; Component Type: Standard; Pin Count: 2; Status: Not Recommended; Manufacturer Part Number: R0603_100K_0.1%_0.063W_10PPM; Case: 0603; Mounted: Yes; Sense: No; Socket: No; SMD: Yes; Manufacturer1 Example: TYCO HOLSWORTHY; Manufacturer1 ComponentHeight: 0.55mm; HelpURL: \\cern.ch\dfs\Applications\Altium\Datasheets\R0603_Tyco_RN73.pdf; Author: CERN DEM JLC; CreateDate: 12/3/2007; LatestRevisionDate: 3/13/2008
R7 R8 R13-R23 R25 R27 R29 R31 R33 R34 R37 R38 R40 R42 R44 = RES 0805 0.125W: RES 0805; Designer: Abbas Basereh; Desc.: RES SMD 0805; Data: 16-12-2016
R24 R26 R28 R30 R32 R35 R36 R39 R41 R43 = RES 1206 0.25W: RES 1206; Designer: Abbas Basereh; Desc.: RES SMD 1206; Data: 16-12-2016
RL1 RL2 = REL_FINDER_40.61.9.009.0000: 16A SPDT PCB Relay, 40.61 Serie; Part Description: 16A, SPDT PCB Relay, 40 Series; Manufacturer: FINDER; PressFit: No; Sense Comment: Non-washable; Status Comment: Sensitive (See Sensitive Field); Value: 9VDC; Part Number: REL_FINDER_40.61.9.009.0000; Component Kind: Standard; Component Type: Standard; Pin Count: 8; PackageDescription: 8 Leads, 1 Pole 16A Relay, FINDER 40.61 Serie, Body 29mm x 12.4mm; Mounted: Yes; Socket: No; SMD: No; Sense: Yes; Status: Not Recommended; Manufacturer Part Number: 40.61.9.009.0000; ComponentHeight: 25mm; HelpURL: \\cern.ch\dfs\Applications\Altium\Datasheets\REL_FINDER_40.61.pdf; Author: CERN DEM JLC; CreateDate: 8/6/2012; LatestRevisionDate: 8/30/2018
Sp1 = MOLEX_22-04-1021: Connector 2 Male; Part Description: 2.5mm (.100") Pitch KK® Wire-to-Board Header, Vertical, with Friction Lock, 2 Circuits, Tin (Sn) Plating; Manufacturer: MOLEX; PressFit: No; Part Number: MOLEX_22-04-1021; Component Kind: Standard; Component Type: Standard; Pin Count: 2; Family: KK®; Mounted: Yes; Socket: No; SMD: No; Sense: No; Status: Obsolete; Manufacturer Part Number: 22-04-1021; ComponentHeight: 11.7mm; HelpURL: \\cern.ch\dfs\Applications\Altium\Datasheets\MOLEX_22-04-1021.pdf; Author: CERN DEM JLC; CreateDate: 2/9/2012; LatestRevisionDate: 2/9/2012
T1-T5 = DG35-5pin: DG35C_Contacts pitch    8.25 mm
U1 U2 = 6N137: HIGH SPEED-10 MBit/s  LOGIC GATE OPTOCOUPLERS; Designer: Saeid Jorablo; Company: ControTEK; Adding Date: 1387/01/08
U3 = STM32G431RBT6: ARMÂ® CortexÂ®-M4F STM32G4 Microcontroller IC 32-Bit Single-Core 170MHz 128KB (128K x 8) FLASH 64-LQFP (10x10); MF: STMicroelectronics; SnapEDA_Link: https://www.snapeda.com/parts/STM32G431RBT6/STMicroelectronics/view-part/?ref=snap; Package: LQFP-64 STMicroelectronics; Value: *; MP: STM32G431RBT6; Check_prices: https://www.snapeda.com/parts/STM32G431RBT6/STMicroelectronics/view-part/?ref=eda
U4 U6 = ISO7221AD: CA-IS3722 High-Speed Dual-Channel Digital Isolators; MF: Texas Instruments; SnapEDA_Link: https://www.snapeda.com/parts/ISO7221AD/Texas+Instruments/view-part/?ref=snap; Package: SOIC-8 Texas Instruments; Value: *; MP: ISO7221AD; Check_prices: https://www.snapeda.com/parts/ISO7221AD/Texas+Instruments/view-part/?ref=eda
U5 = W25Q64BVSSIG: FLASH - NOR Memory IC 64Mb (8M x 8) SPI 80 MHz 8-SOIC; MF: Winbond Electronics; SnapEDA_Link: https://www.snapeda.com/parts/W25Q64BVSSIG/Winbond/view-part/?ref=snap; Package: SOIC-8 Winbond; Value: *; MP: W25Q64BVSSIG; Check_prices: https://www.snapeda.com/parts/W25Q64BVSSIG/Winbond/view-part/?ref=eda
U7 = PAM8403: Audio Amp Speaker 2-CH Stereo 3.2W Class-D 16-Pin SOP T/R; MF: Diodes Zetex; SnapEDA_Link: https://www.snapeda.com/parts/PAM8403/Diodes+Inc./view-part/?ref=snap; Package: None; Value: *; MP: PAM8403; Check_prices: https://www.snapeda.com/parts/PAM8403/Diodes+Inc./view-part/?ref=eda
U8 = ULN2003A: SEVEN DARLINGTON ARRAYS; Published: 2017-3-2; DatasheetVersion: STMicroelectronics GROUP OF COMPANIES; PackageVersion: 2017-3-2; PackageReference: SO16_N; Publisher: Abbas Basereh; PackageDescription: 16-Pin Small Outline Integrated Circuit 1.27 mm Pitch, IPC High Density; Supplier 1: Digi-Key; Supplier Part Number 1: ULN2003A; Supplier 2: Mouser; Supplier Part Number 2: ULN2003A; ComponentLink1Description: Datasheet; ComponentLink2URL: http://www.st.com
U9 = ESP32-WROOM-32D-N4: Bluetooth, WiFi 802.11b/g/n, Bluetooth v4.2 +EDR, Class 1, 2 and 3 Transceiver Module 2.4GHz ~ 2.5GHz Integrated, Trace Surface Mount; MF: Espressif Systems; SnapEDA_Link: https://www.snapeda.com/parts/ESP32-WROOM-32D-N4/Espressif+Systems/view-part/?ref=snap; Package: Non Standard Espressif Systems; Value: *; MP: ESP32-WROOM-32D-N4; Check_prices: https://www.snapeda.com/parts/ESP32-WROOM-32D-N4/Espressif+Systems/view-part/?ref=eda
UP1 UP2 = AMS1117-x.x: x.x Volt, 800mA Low-Dropout Linear Regulator, 4-pin SOT-223; Designer: Ali Hafizi; Data: 16-12-2016
Y1 = XTAL: XTAL Crystal; Designer: ABBAS BASEREH; Value: 12 MHz; Design Date: 2017-1-3; ComponentLink1Description: Datasheet; ComponentLink2Description: Reference; Mounting Technology: Surface Mount\Through-Hole; Status: Unreleased
Y2 = Crystal-ABS09-32.768KHZ-T: 32.768 kHz Â±20ppm Crystal 12.5pF 70 kOhms 2-SMD, No Lead; MF: Abracon LLC; Purchase-URL: https://pricing.snapeda.com/search/part/ABS09-32.768KHZ-T/?ref=eda; SnapEDA_Link: https://www.snapeda.com/parts/ABS09-32.768KHZ-T/Abracon+LLC/view-part/?ref=snap; Value: *; MP: ABS09-32.768KHZ-T; Package: SMD-2 Abracon LLC; Availability: In Stock; Price: None; Check_prices: https://www.snapeda.com/parts/ABS09-32.768KHZ-T/Abracon+LLC/view-part/?ref=eda